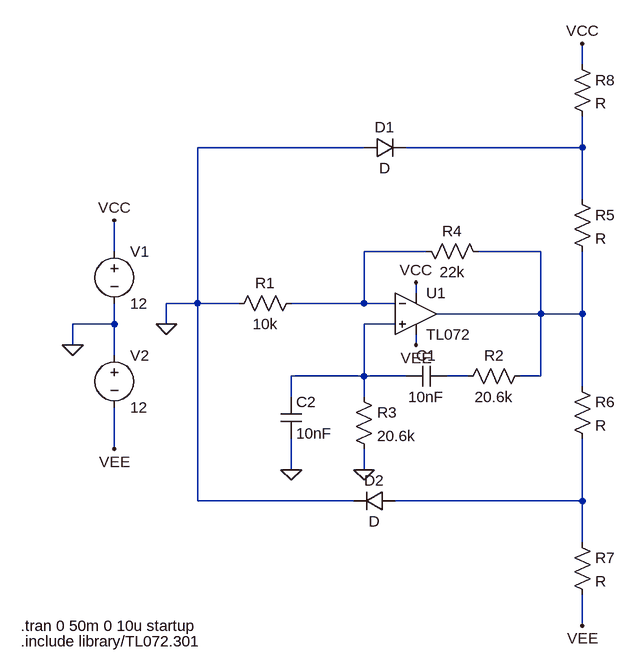
[diagram p0: schematic Draft1.asc]
Draft1.asc, the LTspice schematic file:
Version 4.1
SHEET 1 880 680
WIRE 288 -624 288 -656
WIRE -48 -496 -304 -496
WIRE 288 -496 288 -544
WIRE 288 -496 16 -496
WIRE 288 -416 288 -496
WIRE -432 -336 -432 -384
WIRE 48 -336 -48 -336
WIRE 224 -336 128 -336
WIRE 32 -272 32 -288
WIRE -304 -256 -304 -496
WIRE -304 -256 -352 -256
WIRE -240 -256 -304 -256
WIRE -48 -256 -48 -336
WIRE -48 -256 -160 -256
WIRE 0 -256 -48 -256
WIRE 224 -240 224 -336
WIRE 224 -240 64 -240
WIRE 288 -240 288 -336
WIRE 288 -240 224 -240
WIRE -432 -224 -432 -256
WIRE -432 -224 -496 -224
WIRE -352 -224 -352 -256
WIRE 0 -224 -48 -224
WIRE -496 -192 -496 -224
WIRE 32 -192 32 -208
WIRE -432 -176 -432 -224
WIRE -48 -144 -48 -224
WIRE -48 -144 -160 -144
WIRE 16 -144 -48 -144
WIRE 112 -144 80 -144
WIRE 224 -144 224 -240
WIRE 224 -144 192 -144
WIRE 288 -128 288 -240
WIRE -160 -112 -160 -144
WIRE -48 -112 -48 -144
WIRE -432 -32 -432 -96
WIRE -160 0 -160 -48
WIRE -48 0 -48 -32
WIRE -304 48 -304 -256
WIRE -64 48 -304 48
WIRE 288 48 288 -48
WIRE 288 48 0 48
WIRE 288 112 288 48
WIRE 288 240 288 192
FLAG -352 -224 0
FLAG -48 0 0
FLAG -160 0 0
FLAG -496 -192 0
FLAG -432 -384 VCC
FLAG 32 -288 VCC
FLAG -432 -32 VEE
FLAG 32 -192 VEE
FLAG 288 -656 VCC
FLAG 288 240 VEE
SYMBOL OpAmps\\opamp2 32 -304 R0
SYMATTR InstName U1
SYMATTR Value TL072
SYMBOL res -144 -272 R90
WINDOW 0 0 56 VBottom 2
WINDOW 3 32 56 VTop 2
SYMATTR InstName R1
SYMATTR Value 10k
SYMBOL res 208 -160 R90
WINDOW 0 0 56 VBottom 2
WINDOW 3 32 56 VTop 2
SYMATTR InstName R2
SYMATTR Value 20.6k
SYMBOL cap 80 -160 R90
WINDOW 0 0 32 VBottom 2
WINDOW 3 32 32 VTop 2
SYMATTR InstName C1
SYMATTR Value 10nF
SYMBOL res -64 -128 R0
SYMATTR InstName R3
SYMATTR Value 20.6k
SYMBOL cap -176 -112 R0
SYMATTR InstName C2
SYMATTR Value 10nF
SYMBOL res 144 -320 M270
WINDOW 0 32 56 VTop 2
WINDOW 3 0 56 VBottom 2
SYMATTR InstName R4
SYMATTR Value 22k
SYMBOL voltage -432 -352 R0
WINDOW 123 0 0 Left 0
WINDOW 39 0 0 Left 0
SYMATTR InstName V1
SYMATTR Value 12
SYMBOL voltage -432 -192 R0
SYMATTR InstName V2
SYMATTR Value 12
SYMBOL res 272 -432 R0
SYMATTR InstName R5
SYMBOL res 272 -144 R0
SYMATTR InstName R6
SYMBOL res 272 96 R0
SYMATTR InstName R7
SYMBOL res 272 -640 R0
SYMATTR InstName R8
SYMBOL diode -48 -480 R270
WINDOW 0 32 32 VTop 2
WINDOW 3 0 32 VBottom 2
SYMATTR InstName D1
SYMBOL diode 0 32 R90
WINDOW 0 0 32 VBottom 2
WINDOW 3 32 32 VTop 2
SYMATTR InstName D2
TEXT -576 264 Left 2 !.include library/TL072.301
TEXT -576 240 Left 2 !.tran 0 50m 0 10u startup

The netlist it stands for:
* Draft1.asc
X§U1 N004 N002 VCC VEE N003 TL072  ; pins In+ In- V+ V- OUT
R1 N002 0 10k
R2 N003 N005 20.6k
C1 N005 N004 10nF
R3 N004 0 20.6k
C2 N004 0 10nF
R4 N003 N002 22k
V1 VCC 0 12
V2 0 VEE 12
R5 N001 N003 R
R6 N003 N006 R
R7 N006 VEE R
R8 VCC N001 R
D1 0 N001 D
D2 N006 0 D
.model D D
.lib standard.dio
.include library/TL072.301
.tran 0 50m 0 10u startup
.backanno
.end